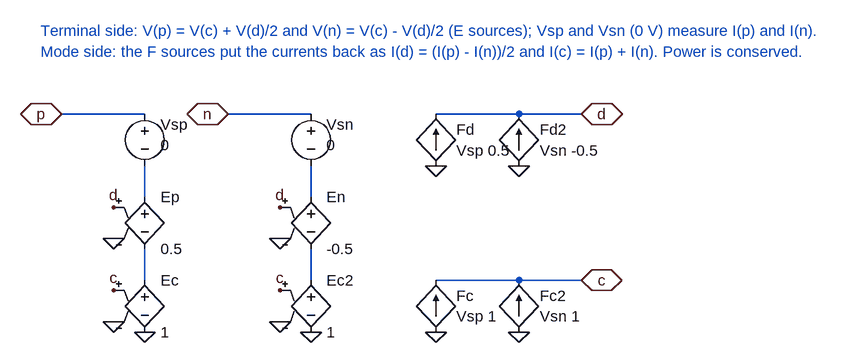
[diagram p0: schematic BalunCircuit.asc]
BalunCircuit.asc, the LTspice schematic file:
Version 4
SHEET 1 1000 600
WIRE 64 64 192 64
WIRE 192 144 192 192
WIRE 192 272 192 320
WIRE 320 64 448 64
WIRE 448 144 448 192
WIRE 448 272 448 320
WIRE 640 64 768 64
WIRE 768 64 864 64
WIRE 640 320 768 320
WIRE 768 320 864 320
FLAG 64 64 p
IOPIN 64 64 BiDir
FLAG 320 64 n
IOPIN 320 64 BiDir
FLAG 864 64 d
IOPIN 864 64 BiDir
FLAG 864 320 c
IOPIN 864 320 BiDir
FLAG 144 208 d
FLAG 144 256 0
FLAG 144 336 c
FLAG 144 384 0
FLAG 192 400 0
FLAG 400 208 d
FLAG 400 256 0
FLAG 400 336 c
FLAG 400 384 0
FLAG 448 400 0
FLAG 640 144 0
FLAG 768 144 0
FLAG 640 400 0
FLAG 768 400 0
SYMBOL voltage 192 48 R0
WINDOW 0 24 32 Left 2
WINDOW 3 24 64 Left 2
SYMATTR InstName Vsp
SYMATTR Value 0
SYMBOL e 192 176 R0
SYMATTR InstName Ep
SYMATTR Value 0.5
SYMBOL e 192 304 R0
SYMATTR InstName Ec
SYMATTR Value 1
SYMBOL voltage 448 48 R0
WINDOW 0 24 32 Left 2
WINDOW 3 24 64 Left 2
SYMATTR InstName Vsn
SYMATTR Value 0
SYMBOL e 448 176 R0
SYMATTR InstName En
SYMATTR Value -0.5
SYMBOL e 448 304 R0
SYMATTR InstName Ec2
SYMATTR Value 1
SYMBOL f 640 144 R180
WINDOW 0 -32 56 Right 2
WINDOW 3 -32 24 Right 2
SYMATTR InstName Fd
SYMATTR Value Vsp 0.5
SYMBOL f 768 144 R180
WINDOW 0 -32 56 Right 2
WINDOW 3 -32 24 Right 2
SYMATTR InstName Fd2
SYMATTR Value Vsn -0.5
SYMBOL f 640 400 R180
WINDOW 0 -32 56 Right 2
WINDOW 3 -32 24 Right 2
SYMATTR InstName Fc
SYMATTR Value Vsp 1
SYMBOL f 768 400 R180
WINDOW 0 -32 56 Right 2
WINDOW 3 -32 24 Right 2
SYMATTR InstName Fc2
SYMATTR Value Vsn 1
TEXT 32 -64 Left 2 ;Terminal side: V(p) = V(c) + V(d)/2 and V(n) = V(c) - V(d)/2 (E sources); Vsp and Vsn (0 V) measure I(p) and I(n).
TEXT 32 -32 Left 2 ;Mode side: the F sources put the currents back as I(d) = (I(p) - I(n))/2 and I(c) = I(p) + I(n). Power is conserved.

The netlist it stands for:
* BalunCircuit.asc
Vsp p N001 0
Ep N001 N002 d 0 0.5
Ec N002 0 c 0 1
Vsn n N003 0
En N003 N004 d 0 -0.5
Ec2 N004 0 c 0 1
Fd 0 d Vsp 0.5
Fd2 0 d Vsn -0.5
Fc 0 c Vsp 1
Fc2 0 c Vsn 1
* Terminal side: V(p) = V(c) + V(d)/2 and V(n) = V(c) - V(d)/2 (E sources); Vsp and Vsn (0 V) measure I(p) and I(n).
* Mode side: the F sources put the currents back as I(d) = (I(p) - I(n))/2 and I(c) = I(p) + I(n). Power is conserved.
.backanno
.end